# EAGLE design PTERODACTYL_v3.8_v11 (EAGLE 9.7.0)
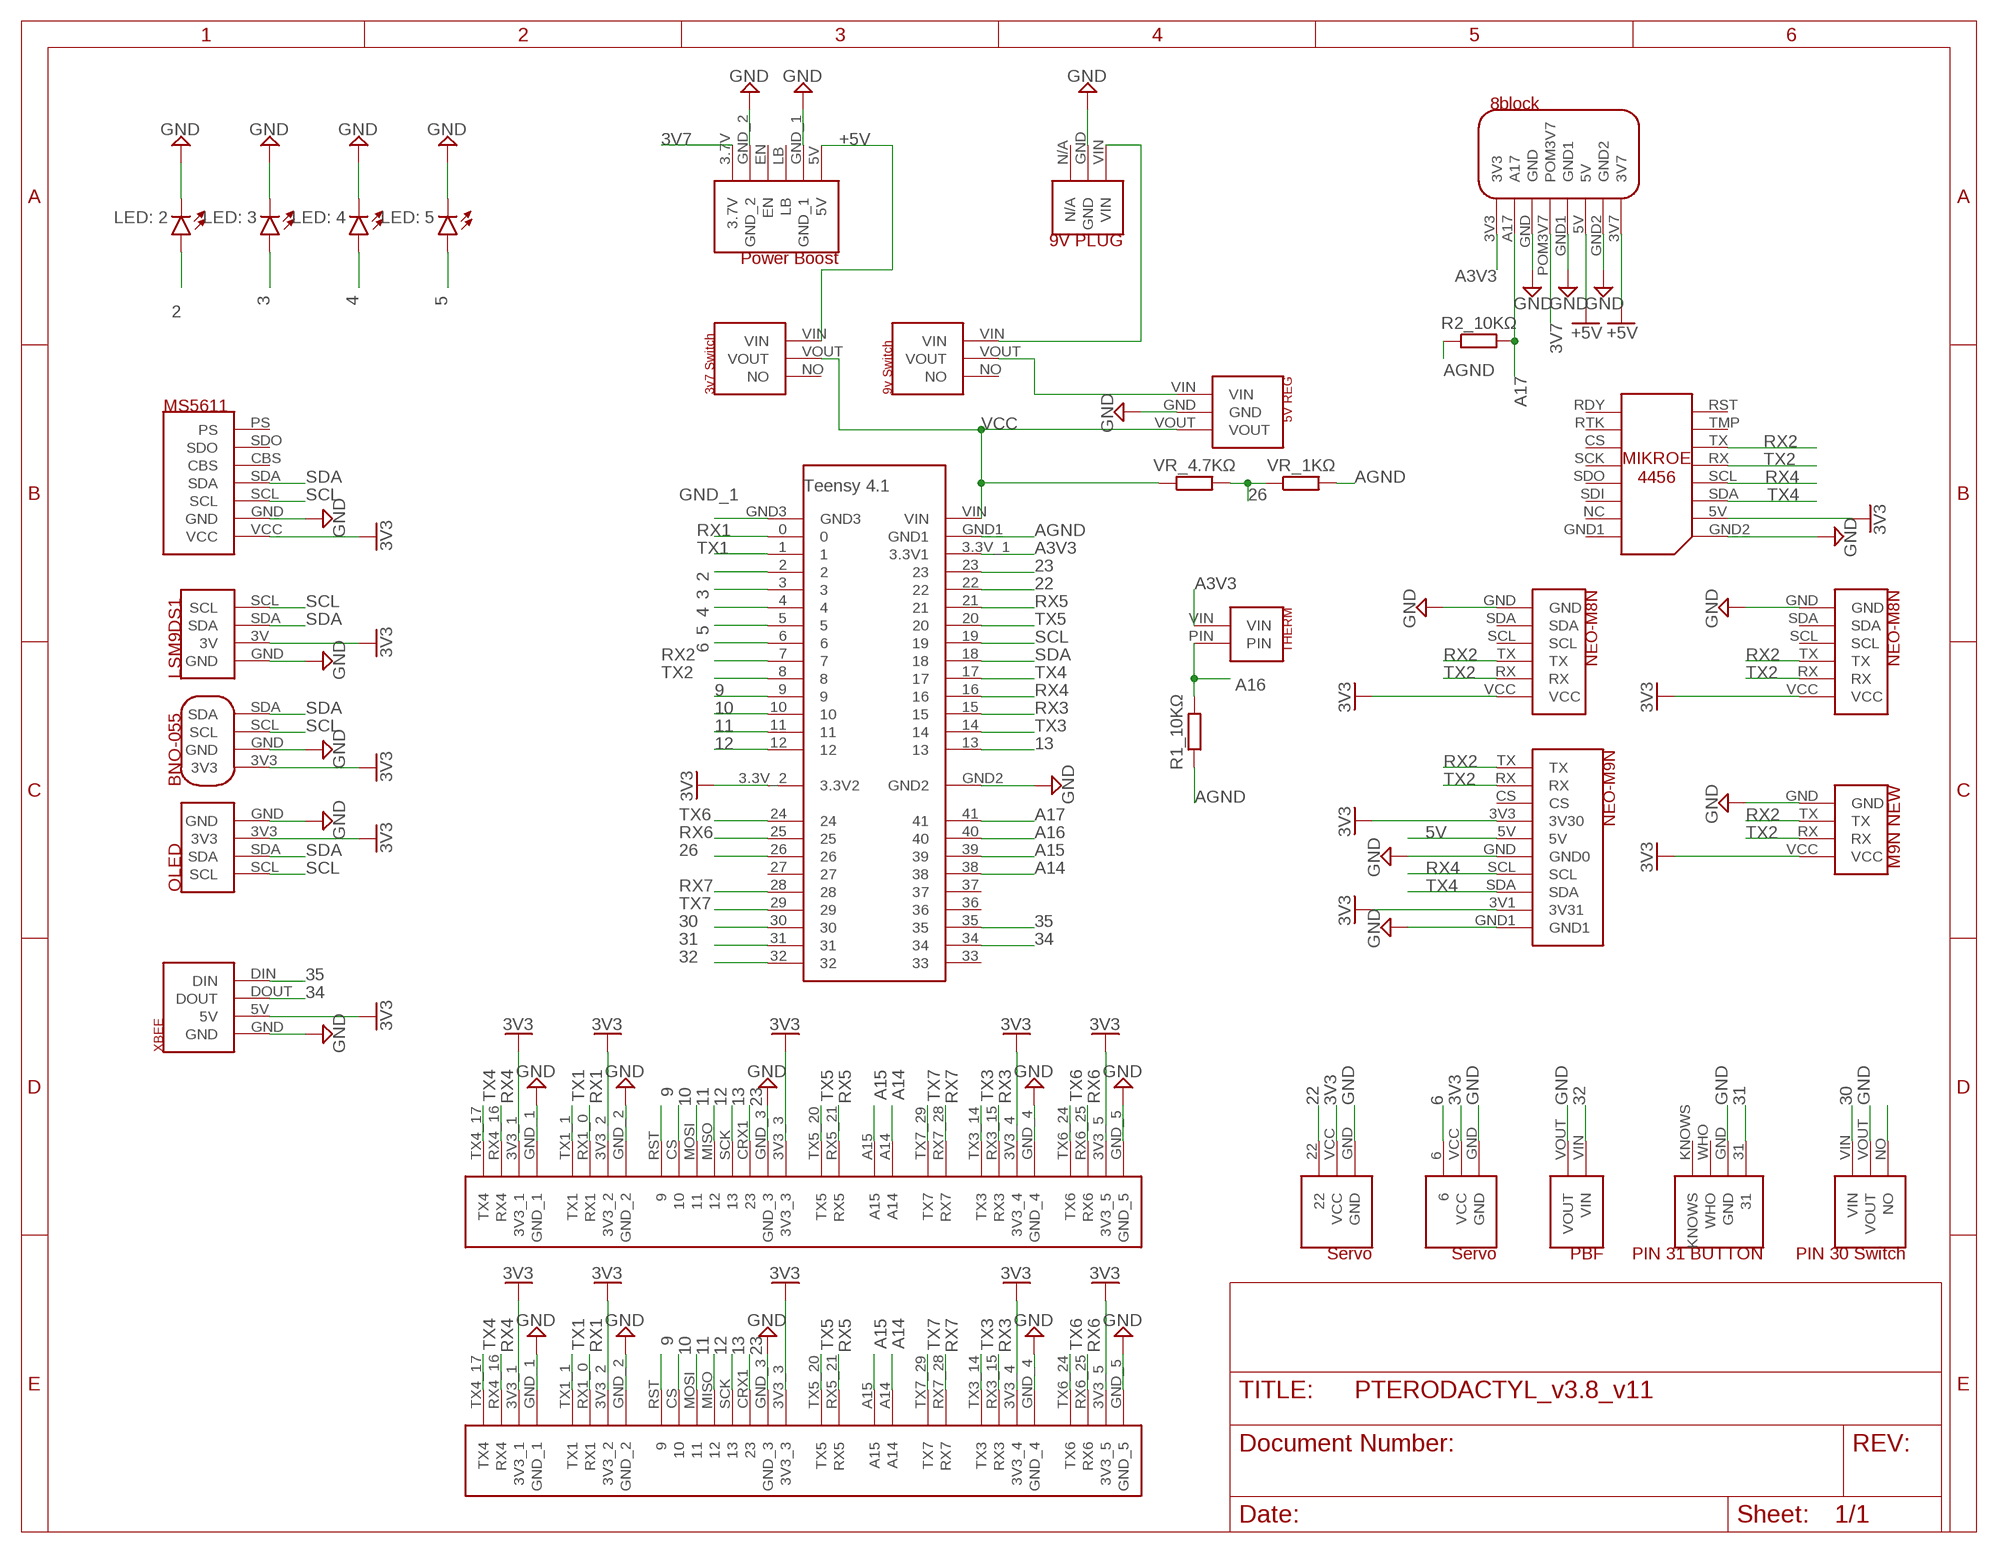
[diagram p0: schematic, sheet 1]

## Parts
D1  LED: 3  LED_RADIAL_WHITE  [LEDRD254W60D565H860B_W]
D2  LED: 4  LED_RADIAL_RED  [LEDRD254W60D565H860B]
D3  LED: 5  LED_RADIAL_BLUE  [LEDRD254W60D565H860B_B]
D4  LED: 2  LED_RADIAL_YELLOW  [LEDRD254W60D565H860B_Y]
R1_10KΩ  R_AXIAL-11.7MM-PITCH  [RESAD1176W63L850D250B]
R2_10KΩ  R_AXIAL-11.7MM-PITCH  [RESAD1176W63L850D250B]
U$1  FEMALE_HEADERS_V1.3  [FEMALE_HEADERS_V1.3]
U$2  TERMINAL_BLOCK_V1.3  [TERMINAL_BLOCK_V1.3]
U$3  TEENSY41_SIMPLE  [TEENSY41_SIMPLE]
U$4  PT8BLOCK  [PTERODACTYL8BLOCK]
U$5  5VREG  [5VREG]
U$6  3V7SWITCH  [3V7SWITCH]
U$7  9VSWITCH  [9VSWITCH]
U$8  9VPLUG  [9VPLUG]
U$9  OLED_SIMPLE  [OLED_SIMPLE]
U$10  LSM9DS1_SIMPLE  [LSM9DS1_SIMPLE]
U$11  MS5611  [MS5611]
U$12  UBLOXM8NTERMINAL  [UBLOXM8NTERMINAL]
U$13  UBLOXM8NSIMPLE  [UBLOXM8NSIMPLE]
U$14  XBEE_SIMPLE  [XBEE_SIMPLE]
U$15  UBLOXM9NSIMPLE  [UBLOXM9NSIMPLE]
U$16  THERMISTOR10K1  [THERMISTOR10K]
U$17  BNO055  [BNO055]
U$22  UBLOXM9N_NEW_SIMPLE  [UBLOXM9N_NEW_SIMPLE]
U$23  SERVO  [PIN6SERVO]
U$24  PBF  [PULLBEFOREFLIGHT]
U$25  BUTTON  [PIN31BUTTON]
U$26  PIN30SWITCH  [PIN30SWITCH]
U$27  SERVO22  [PI22SERVO]
U$28  POWERBOOST  [5VPOWERBOOST]
U$29  MIKROE  [MIKROE]
VR_1KΩ  R_AXIAL-11.7MM-PITCH  [RESAD1176W63L850D250B]
VR_4.7KΩ  R_AXIAL-11.7MM-PITCH  [RESAD1176W63L850D250B]

## Nets
2: D4.1(A) U$3.2
3: D1.1(A) U$3.3
3V3: U$1.3V3_1 U$1.3V3_2 U$1.3V3_3 U$1.3V3_4 U$1.3V3_5 U$2.3V3_1 U$2.3V3_2 U$2.3V3_3 U$2.3V3_4 U$2.3V3_5 U$3.3.3V_2(3.3V2) U$9.3V3 U$10.3V U$11.VCC U$12.VCC U$13.VCC U$14.5V U$15.3V1(3V31) U$15.3V3(3V30) U$17.3V3 U$22.VCC U$23.VCC U$27.VCC U$29.5V
3V7: U$4.POM3V7 U$28.3.7V
4: D2.1(A) U$3.4
5: D3.1(A) U$3.5
5V: U$15.5V
6: U$3.6 U$23.6
9: U$1.RST U$2.RST U$3.9
10: U$1.CS U$2.CS U$3.10
11: U$1.MOSI U$2.MOSI U$3.11
12: U$1.MISO U$2.MISO U$3.12
13: U$1.SCK U$2.SCK U$3.13
22: U$3.22 U$27.22
23: U$1.CRX1 U$2.CRX1 U$3.23
26: U$3.26 VR_1KΩ.1 VR_4.7KΩ.2
30: U$3.30 U$26.VIN
31: U$3.31 U$25.31
32: U$3.32 U$24.VIN
34: U$3.34 U$14.DOUT
35: U$3.35 U$14.DIN
+5V: U$4.3V7 U$4.5V U$6.VIN U$28.5V
A3V3: U$3.3.3V_1(3.3V1) U$4.3V3 U$16.VIN
A14: U$1.A14 U$2.A14 U$3.38
A15: U$1.A15 U$2.A15 U$3.39
A16: R1_10KΩ.2 U$3.40 U$16.PIN
A17: R2_10KΩ.2 U$3.41 U$4.A17
AGND: R1_10KΩ.1 R2_10KΩ.1 U$3.GND1 VR_1KΩ.2
GND: D1.2(C) D2.2(C) D3.2(C) D4.2(C) U$1.GND_1 U$1.GND_2 U$1.GND_3 U$1.GND_4 U$1.GND_5 U$2.GND_1 U$2.GND_2 U$2.GND_3 U$2.GND_4 U$2.GND_5 U$3.GND2 U$4.GND U$4.GND1 U$4.GND2 U$5.GND U$8.GND U$9.GND U$10.GND U$11.GND U$12.GND U$13.GND U$14.GND U$15.GND1 U$15.GND(GND0) U$17.GND U$22.GND U$23.GND U$24.VOUT U$25.GND U$26.VOUT U$27.GND U$28.GND_1 U$28.GND_2 U$29.GND2
GND_1: U$3.GND3
N$14: U$26.NO
RX1: U$1.RX1_0(RX1) U$2.RX1_0(RX1) U$3.0
RX2: U$3.7 U$12.TX U$13.TX U$15.TX U$22.TX U$29.TX
RX3: U$1.RX3_15(RX3) U$2.RX3_15(RX3) U$3.15
RX4: U$1.RX4_16(RX4) U$2.RX4_16(RX4) U$3.16 U$15.SCL U$29.SCL
RX5: U$1.RX5_21(RX5) U$2.RX5_21(RX5) U$3.21
RX6: U$1.RX6_25(RX6) U$2.RX6_25(RX6) U$3.25
RX7: U$1.RX7_28(RX7) U$2.RX7_28(RX7) U$3.28
SCL: U$3.19 U$9.SCL U$10.SCL U$11.SCL U$17.SCL
SDA: U$3.18 U$9.SDA U$10.SDA U$11.SDA U$17.SDA
TX1: U$1.TX1_1(TX1) U$2.TX1_1(TX1) U$3.1
TX2: U$3.8 U$12.RX U$13.RX U$15.RX U$22.RX U$29.RX
TX3: U$1.TX3_14(TX3) U$2.TX3_14(TX3) U$3.14
TX4: U$1.TX4_17(TX4) U$2.TX4_17(TX4) U$3.17 U$15.SDA U$29.SDA
TX5: U$1.TX5_20(TX5) U$2.TX5_20(TX5) U$3.20
TX6: U$1.TX6_24(TX6) U$2.TX6_24(TX6) U$3.24
TX7: U$1.TX7_29(TX7) U$2.TX7_29(TX7) U$3.29
VCC: U$3.VIN U$5.VOUT U$6.VOUT VR_4.7KΩ.1
VCC_2: U$7.VIN U$8.VIN
VCC_3: U$5.VIN U$7.VOUT
Unconnected: U$3.27 U$3.33 U$3.36 U$3.37 U$6.NO U$7.NO U$8.N/A U$11.CBS U$11.PS U$11.SDO U$12.SCL U$12.SDA U$13.SCL U$13.SDA U$15.CS U$25.KNOWS U$25.WHO U$28.EN U$28.LB U$29.CS U$29.GND1 U$29.NC U$29.RDY U$29.RST U$29.RTK U$29.SCK U$29.SDI U$29.SDO U$29.TMP

## Library data of the parts
D1 = Opto-Electronic:LED_RADIAL: LED - Generic; CATEGORY: Opto-Electronic; SUB-CATEGORY: LED; VALUE: LED_WHITE
D2 = Opto-Electronic:LED_RADIAL: LED - Generic; CATEGORY: Opto-Electronic; SUB-CATEGORY: LED; VALUE: LED_RED
D3 = Opto-Electronic:LED_RADIAL: LED - Generic; CATEGORY: Opto-Electronic; SUB-CATEGORY: LED; VALUE: LED_BLUE
D4 = Opto-Electronic:LED_RADIAL: LED - Generic; CATEGORY: Opto-Electronic; SUB-CATEGORY: LED; VALUE: LED_YELLOW
R1_10KΩ R2_10KΩ VR_1KΩ VR_4.7KΩ = Resistor:R: Resistor Fixed - Generic; CATEGORY: Resistor; SUB-CATEGORY: Fixed
U$1 = EXTRAPINS:FEMALE_HEADERS_V1.3
U$2 = EXTRAPINS:TERMINAL_BLOCK_V1.3
U$3 = Teensy41:TEENSY41_SIMPLE
U$4 = EXTRAPINS:PT8BLOCK
U$5 = 5V Reg:5VREG
U$6 = SWITCH:3V7SWITCH
U$7 = SWITCH:9VSWITCH
U$8 = 9V Plug:9VPLUG
U$9 = SparkFun OLED:OLED_SIMPLE
U$10 = LSM9DS1:LSM9DS1_SIMPLE
U$11 = MS5611:MS5611
U$12 = UBLOX GPS:UBLOXM8NTERMINAL
U$13 = UBLOX GPS:UBLOXM8NSIMPLE
U$14 = XBEE:XBEE_SIMPLE
U$15 = UBLOX GPS:UBLOXM9NSIMPLE
U$16 = Thermistor:THERMISTOR10K1
U$17 = BNO055:BNO055
U$22 = UBLOX GPS:UBLOXM9N_NEW_SIMPLE
U$23 = SWITCH:SERVO
U$24 = SWITCH:PBF
U$25 = SWITCH:BUTTON
U$26 = SWITCH:PIN30SWITCH
U$27 = SWITCH:SERVO22
U$28 = Power Boost 3.7 to 5v:POWERBOOST
U$29 = MIKROE_4456:MIKROE

## Board
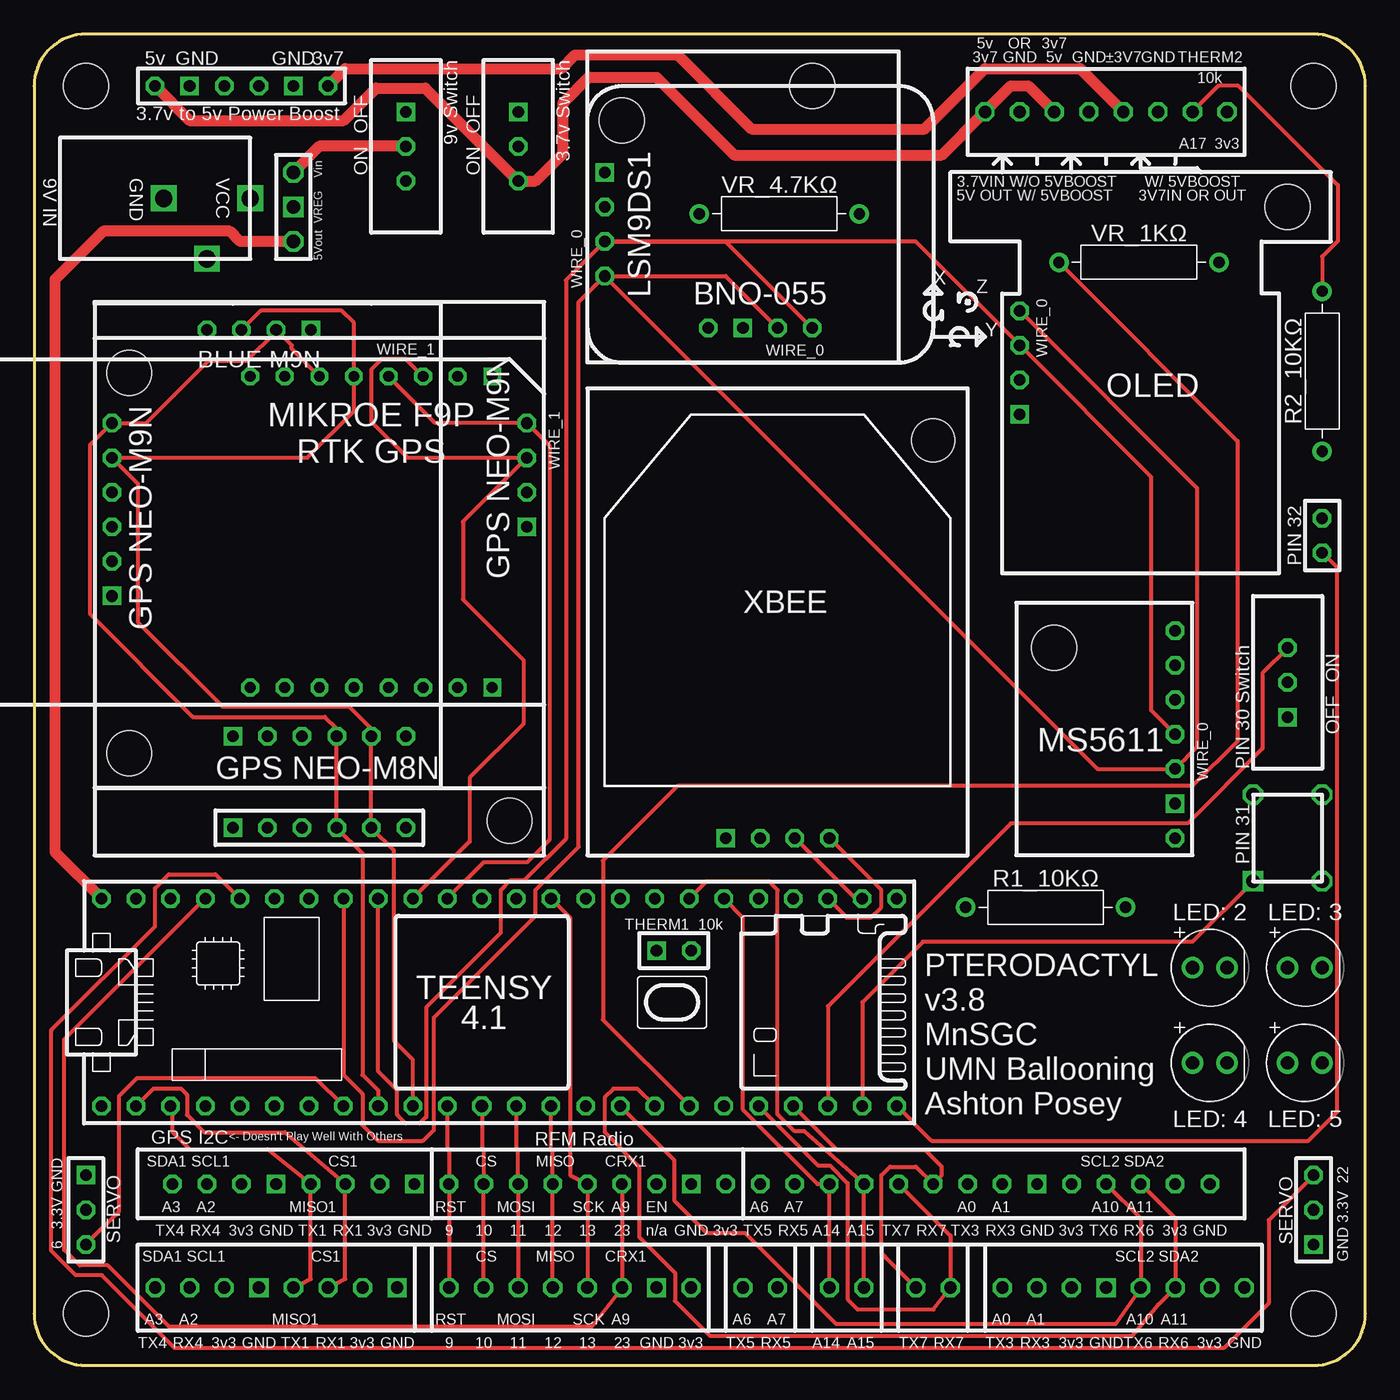
[diagram p1: board, top side]
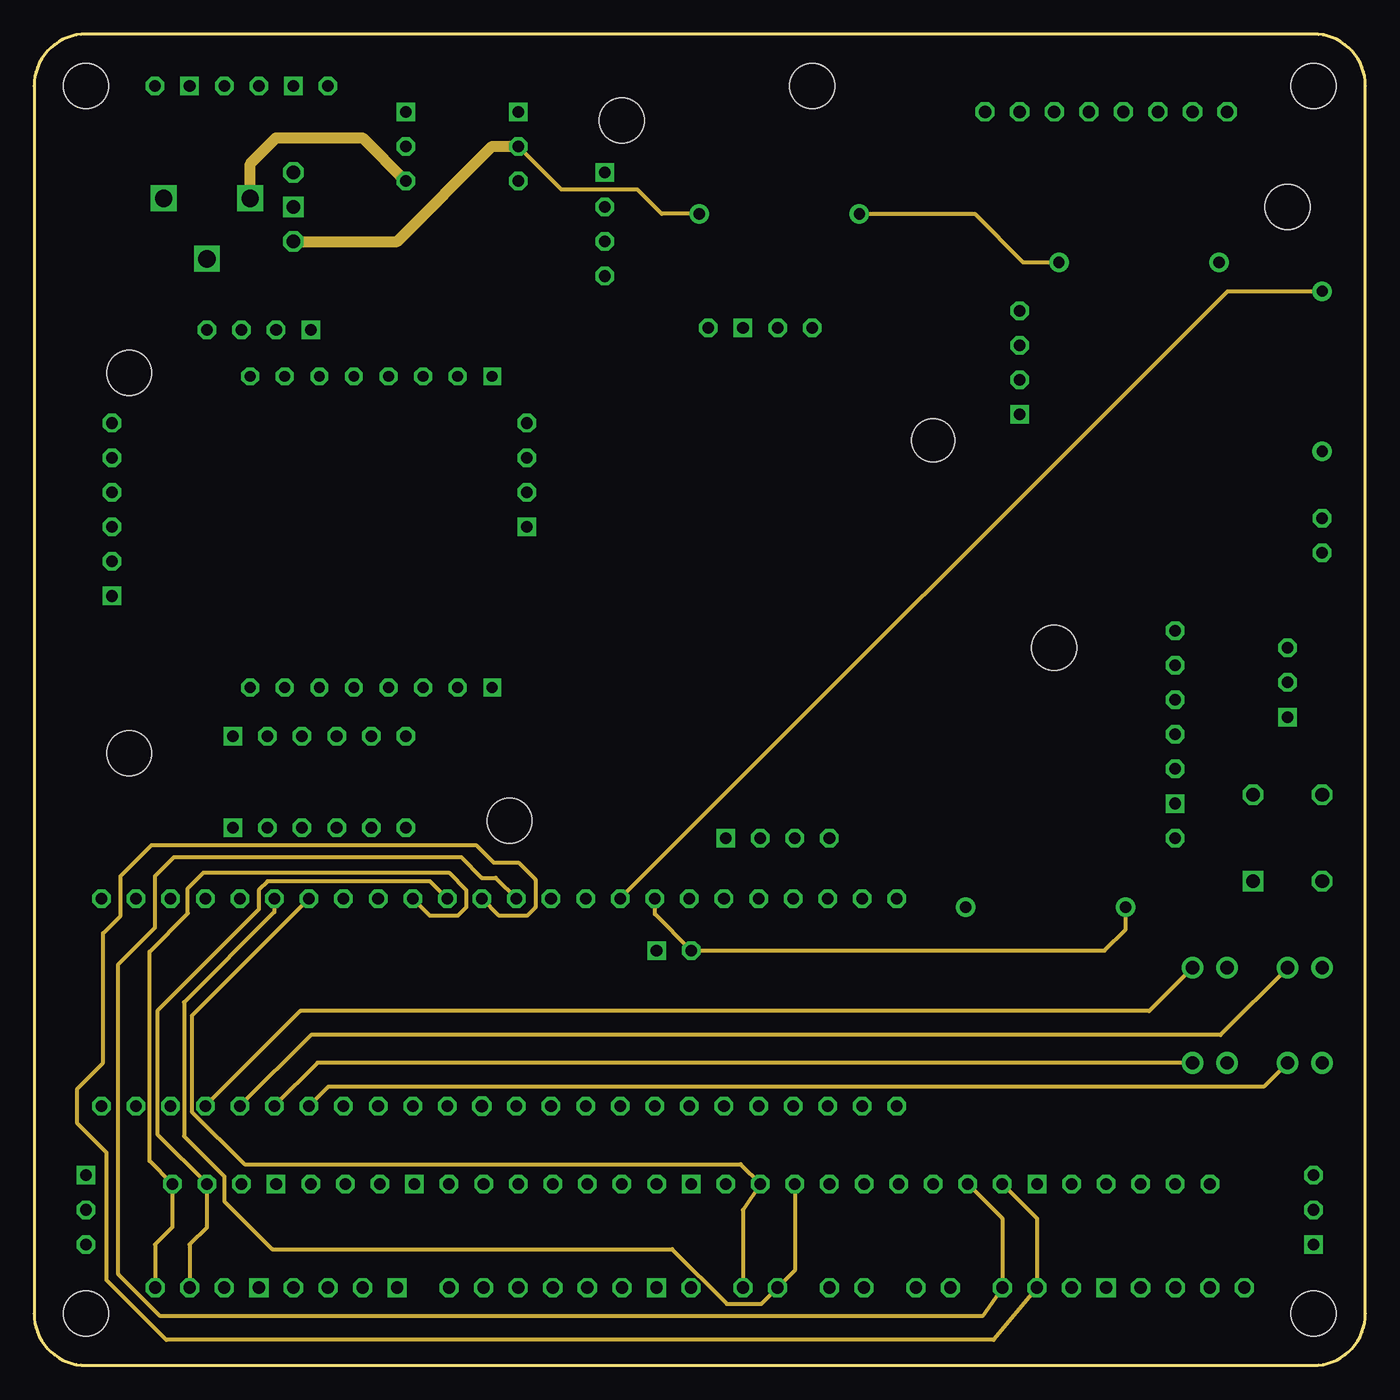
[diagram p2: board, inner layer Route2]
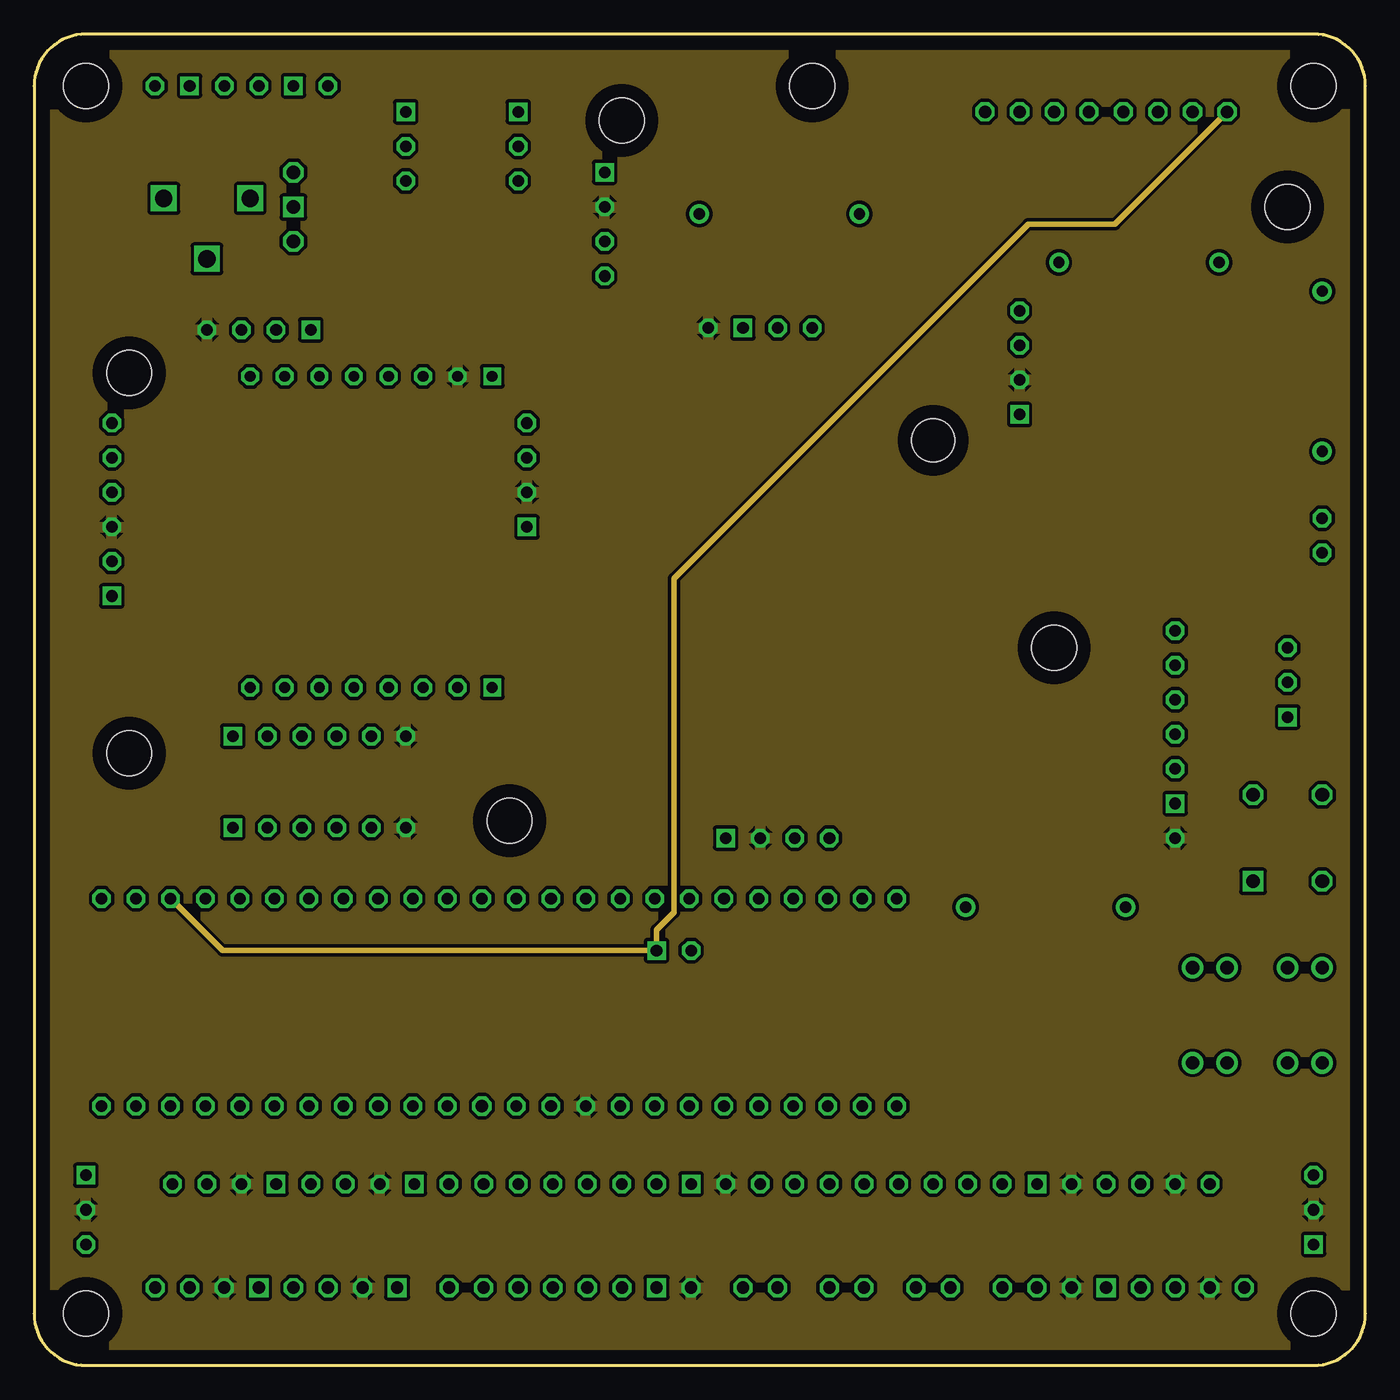
[diagram p3: board, inner layer Route15]
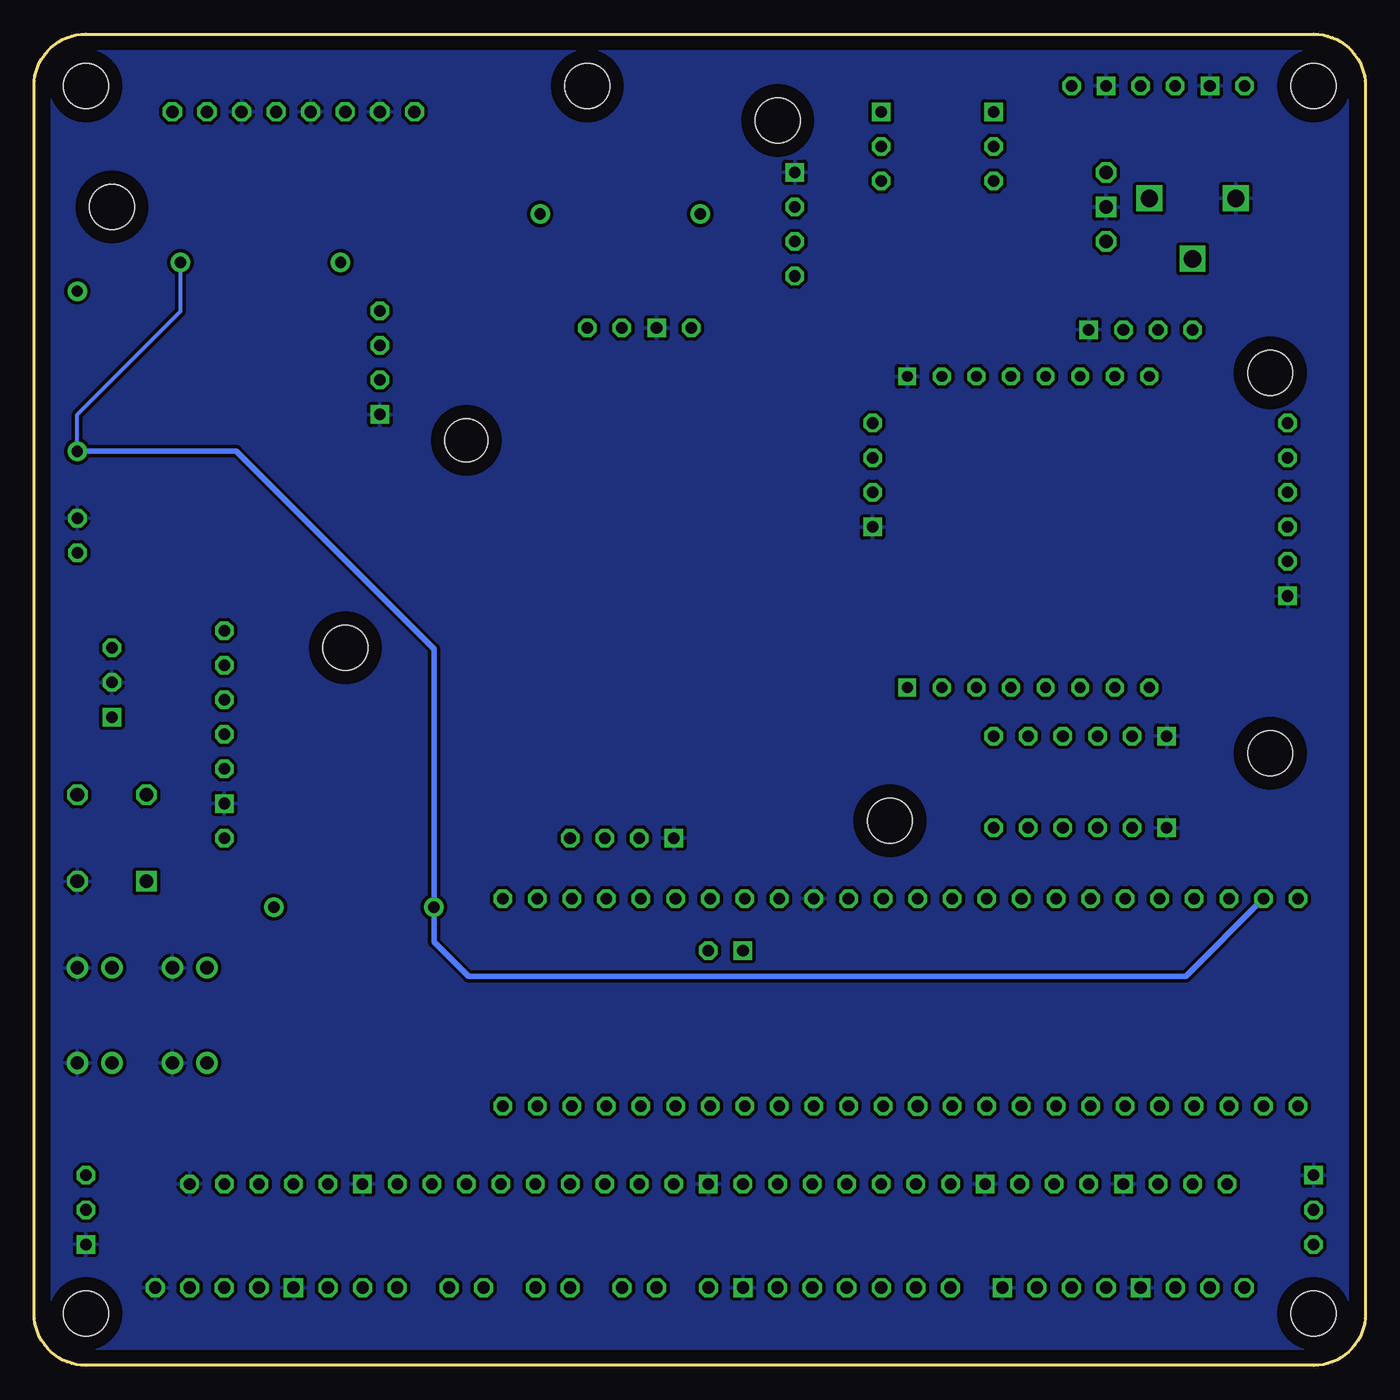
[diagram p4: board, bottom side, seen from below]

Size 97.79 x 97.79 mm. Coordinates in mm from the lower left corner, seen from the top.
Outline: 3.81,97.79 arc90 0,93.98 0,3.81 arc90 3.81,0 93.98,0 arc90 97.79,3.81 97.79,93.98 arc90 93.98,97.79 3.81,97.79
Copper layers (1+2*15+16): Top / Route2 / Route15 / Bottom
Stack-up 4 Layer Stack: Top SilkScreen Epoxy Ink / Top SolderMask User Defined 0.0254mm Dk 4.3 / Top Surface Finish Lead-Free 0.02mm / Top CuFoil:007 0.035mm / Dielectric-1 Prepreg:001 0.064mm / Dielectric-2 Prepreg:001 0.064mm / Route2 CuFoil:007 0.035mm / Dielectric-3 Core:066 0.711mm / Route15 CuFoil:007 0.035mm / Dielectric-4 Prepreg:001 0.064mm / Dielectric-5 Prepreg:001 0.064mm / Bottom CuFoil:007 0.035mm / Bottom Surface Finish Lead-Free 0.02mm / Bottom SolderMask User Defined 0.0254mm Dk 4.3 / Bottom SilkScreen Epoxy Ink
Design rules: minimum drill size 0.35mm, minimum copper width 6mil, keepout clearance 0mil, drill distance 6mil, via restrict clearance 0mil, dimension clearance 40mil, restrict clearance 0mil, copper clearance wire_polygon to wire_polygon 6mil, copper clearance wire_polygon to pad_smd 6mil, copper clearance wire_polygon to via 6mil, copper clearance pad_smd to pad_smd 6mil, copper clearance pad_smd to via 6mil, copper clearance via to via 6mil, copper clearance smd to pad (same net) 6mil, copper clearance smd to via (same net) 6mil, copper clearance smd to smd (same net) 6mil

### Footprints (pad centres in the part's own frame; a part is rotated, then mirrored left to right if it is on the bottom)
LEDRD254W60D565H860B_W = drill 0.981 pad 1.581: 1 -1.27,0; 2 1.27,0
LEDRD254W60D565H860B = drill 0.981 pad 1.581: 1 -1.27,0; 2 1.27,0
LEDRD254W60D565H860B_B = drill 0.981 pad 1.581: 1 -1.27,0; 2 1.27,0
LEDRD254W60D565H860B_Y = drill 0.981 pad 1.581: 1 -1.27,0; 2 1.27,0
RESAD1176W63L850D250B = drill 0.83 pad 1.43: 1 -5.88,0; 2 5.88,0
FEMALE_HEADERS_V1.3 = drill 0.85 octagon: 3V3_1 7.62,2.54; 3V3_2 17.78,2.54; 3V3_3 43.18,2.54; 3V3_4 68.58,2.54; 3V3_5 76.2,2.54; A14 50.8,2.54; A15 53.34,2.54; CRX1 35.56,2.54; CS 25.4,2.54; GND_5 78.74,2.54; MISO 30.48,2.54; MOSI 27.94,2.54; P$1 38.1,2.54; RST 22.86,2.54; RX1_0 15.24,2.54; RX3_15 63.5,2.54; RX4_16 5.08,2.54; RX5_21 48.26,2.54; RX6_25 73.66,2.54; RX7_28 55.88,2.54; SCK 33.02,2.54; TX1_1 12.7,2.54; TX3_14 60.96,2.54; TX4_17 2.54,2.54; TX5_20 45.72,2.54; TX6_24 71.12,2.54; TX7_29 58.42,2.54 | drill 0.85 square: GND_1 10.16,2.54; GND_2 20.32,2.54; GND_3 40.64,2.54; GND_4 66.04,2.54
TERMINAL_BLOCK_V1.3 = drill 0.9 octagon: 3V3_1 5.08,3.175; 3V3_2 15.24,3.175; 3V3_3 39.37,3.175; 3V3_4 67.31,3.175; 3V3_5 77.47,3.175; A14 49.53,3.175; A15 52.07,3.175; CRX1 34.29,3.175; CS 24.13,3.175; GND_5 80.01,3.175; MISO 29.21,3.175; MOSI 26.67,3.175; RST 21.59,3.175; RX1_0 12.7,3.175; RX3_15 64.77,3.175; RX4_16 2.54,3.175; RX5_21 45.72,3.175; RX6_25 74.93,3.175; RX7_28 58.42,3.175; SCK 31.75,3.175; TX1_1 10.16,3.175; TX3_14 62.23,3.175; TX4_17 0,3.175; TX5_20 43.18,3.175; TX6_24 72.39,3.175; TX7_29 55.88,3.175 | drill 0.9 square: GND_1 7.62,3.175; GND_2 17.78,3.175; GND_3 36.83,3.175; GND_4 69.85,3.175
TEENSY41_SIMPLE = drill 0.85 octagon: 0 -25.527,-7.62; 1 -22.987,-7.62; 2 -20.447,-7.62; 3 -17.907,-7.62; 3.3V_1 -22.987,7.62; 3.3V_2 7.493,-7.62; 4 -15.367,-7.62; 5 -12.827,-7.62; 6 -10.287,-7.62; 7 -7.747,-7.62; 8 -5.207,-7.62; 9 -2.667,-7.62; 11 2.413,-7.62; 12 4.953,-7.62; 13 4.953,7.62; 14 2.413,7.62; 15 -0.127,7.62; 16 -2.667,7.62; 17 -5.207,7.62; 18 -7.747,7.62; 19 -10.287,7.62; 20 -12.827,7.62; 21 -15.367,7.62; 22 -17.907,7.62; 23 -20.447,7.62; 24 10.033,-7.62; 25 12.573,-7.62; 26 15.113,-7.62; 27 17.653,-7.62; 28 20.193,-7.62; 29 22.733,-7.62; 30 25.273,-7.62; 31 27.813,-7.62; 32 30.353,-7.62; 33 30.353,7.62; 34 27.813,7.62; 35 25.273,7.62; 36 22.733,7.62; 37 20.193,7.62; 38 17.653,7.62; 39 15.113,7.62; 40 12.573,7.62; 41 10.033,7.62; GND1 -25.527,7.62; GND2 7.493,7.62; GND3 -28.067,-7.62; VIN -28.067,7.62 | drill 0.9 octagon: 10 -0.127,-7.62
PTERODACTYL8BLOCK = drill 0.9 octagon: 3V3 1.27,3.175; 3V7 19.05,3.175; 5V 13.97,3.175; A17 3.81,3.175; GND 6.35,3.175; GND1 11.43,3.175; GND2 16.51,3.175; POM3V7 8.89,3.175
5VREG = drill 1 square: GND 3.81,1.27 | drill 1 octagon: VIN 1.27,1.27; VOUT 6.35,1.27
3V7SWITCH = drill 0.85 square: NO 3.81,2.54 | drill 0.85 octagon: VIN 8.89,2.54; VOUT 6.35,2.54
9VSWITCH = drill 0.85 square: NO -2.54,0 | drill 0.85 octagon: VIN 2.54,0; VOUT 0,0
9VPLUG = drill 1.27 square: GND 7.62,4.445; N/A 10.795,0; VIN 13.97,4.445
OLED_SIMPLE = drill 0.85 octagon: 3V3 1.27,-6.35; SCL 1.27,-1.27; SDA 1.27,-3.81 | drill 0.85 square: GND 1.27,-8.89 | hole 3.302: 20.955,6.35
LSM9DS1_SIMPLE = drill 0.85 octagon: 3V 1.27,11.43; SCL 1.27,6.35; SDA 1.27,8.89 | drill 0.85 square: GND 1.27,13.97 | hole 3.302: 16.51,20.32
MS5611 = drill 0.85 octagon: CBS -1.27,11.43; PS -1.27,16.51; SCL -1.27,6.35; SDA -1.27,8.89; SDO -1.27,13.97; VCC -1.27,1.27 | drill 0.85 square: GND -1.27,3.81 | hole 3.302: -10.16,15.24
UBLOXM8NTERMINAL = drill 0.85 square: GND 1.27,1.27 | drill 0.85 octagon: RX 11.43,1.27; SCL 6.35,1.27; SDA 3.81,1.27; TX 8.89,1.27; VCC 13.97,1.27
UBLOXM8NSIMPLE = drill 0.85 square: GND 10.16,3.81 | drill 0.85 octagon: RX 20.32,3.81; SCL 15.24,3.81; SDA 12.7,3.81; TX 17.78,3.81; VCC 22.86,3.81 | hole 3.302: 2.54,30.48
XBEE_SIMPLE = drill 0.85 octagon: 5V 12.7,1.27; DIN 17.78,1.27; DOUT 15.24,1.27 | drill 0.85 square: GND 10.16,1.27 | hole 3.175: 25.4,30.48
UBLOXM9NSIMPLE = drill 0.85 octagon: 3V1 1.27,13.97; 3V3 31.75,16.51; 5V 31.75,19.05; CS 31.75,13.97; RX 31.75,11.43; SCL 1.27,8.89; SDA 1.27,11.43; TX 31.75,8.89 | drill 0.85 square: GND 31.75,21.59; GND1 1.27,16.51 | hole 3.302: 2.54,38.1
THERMISTOR10K = drill 0.85 octagon: PIN 3.81,1.27 | drill 0.85 square: VIN 1.27,1.27
BNO055 = drill 0.85 octagon: 3V3 8.89,2.54; SCL 13.97,2.54; SDA 16.51,2.54 | drill 0.85 square: GND 11.43,2.54 | hole 3.302: 2.54,17.78
HOLE = hole 3.302: 0,0
UBLOXM9N_NEW_SIMPLE = drill 0.85 square: GND 9.525,1.905 | drill 0.85 octagon: RX 14.605,1.905; TX 12.065,1.905; VCC 17.145,1.905 | hole 3.302: 22.86,33.02
PIN6SERVO = drill 0.85 octagon: 6 6.35,1.27; VCC 3.81,1.27 | drill 0.85 square: GND 1.27,1.27
PULLBEFOREFLIGHT = drill 0.85 octagon: VIN 1.27,1.27; VOUT 3.81,1.27
PIN31BUTTON = drill 1 square: 31 0,0 | drill 1 octagon: GND 5.08,0; KNOWS 5.08,6.35; WHO 0,6.35
PIN30SWITCH = drill 0.85 square: NO -2.54,0 | drill 0.85 octagon: VIN 2.54,0; VOUT 0,0
PI22SERVO = drill 0.85 octagon: 22 6.35,1.27; VCC 3.81,1.27 | drill 0.85 square: GND 1.27,1.27
5VPOWERBOOST = drill 0.85 octagon: 3.7V -6.35,0; 5V 6.35,0; EN 1.27,0; LB -1.27,0 | drill 0.85 square: GND_1 -3.81,0; GND_2 3.81,0
MIKROE = drill 0.8 octagon: 5V 24.13,6.35; CS 1.27,16.51; NC 1.27,6.35; RDY 1.27,21.59; RST 24.13,21.59; RTK 1.27,19.05; RX 24.13,13.97; SCK 1.27,13.97; SCL 24.13,11.43; SDA 24.13,8.89; SDI 1.27,8.89; SDO 1.27,11.43; TMP 24.13,19.05; TX 24.13,16.51 | drill 0.8 square: GND1 1.27,3.81; GND2 24.13,3.81

### Placement (x,y rotation side)
D1  93.34,29.21 0 top
D2  86.36,22.23 0 top
D3  93.34,22.23 0 top
D4  86.36,29.21 0 top
R1_10KΩ  74.3,33.66 0 top
R2_10KΩ  94.62,73.03 90 top
U$1  7.62,10.79 0 top
U$2  8.89,2.54 0 top
U$3  33.02,26.67 0 top
U$4  88.9,95.25 180 top
U$5  17.78,88.9 270 top
U$6  33.02,95.89 270 top
U$7  27.31,89.53 270 top
U$8  1.91,81.28 0 top
U$9  71.12,78.74 0 top
U$10  40.64,73.66 0 top
U$11  85.09,37.47 0 top
U$12  13.34,38.23 0 top
U$13  4.45,42.42 0 top
U$14  40.64,37.47 0 top
U$15  37.47,78.11 180 top
U$16  44.45,29.21 0 top
U$17  40.64,73.66 0 top
U$18  [HOLE]  93.98,3.81 0 bottom
U$19  [HOLE]  93.98,93.98 0 bottom
U$20  [HOLE]  3.81,93.98 0 bottom
U$21  [HOLE]  3.81,3.81 0 bottom
U$22  29.85,77.98 180 top
U$23  2.54,15.24 270 top
U$24  95.89,58.42 90 top
U$25  89.54,35.56 0 top
U$26  92.08,50.16 90 top
U$27  95.25,7.62 90 top
U$28  15.24,93.98 180 top
U$29  37.47,48.51 90 top
U$30  [PTERODACTYLV3.1]  65.41,18.41 0 top
U$32  [AXIS]  65.41,74.93 0 top
VR_1KΩ  81.15,81.03 0 top
VR_4.7KΩ  54.74,84.58 0 top

### Tracks (layer width: path | path; a pad name or v marks a point on that pad's centre or on a via)
2
  Route2 0.305: D4.1 81.92,26.04 19.56,26.04 U$3.2
3
  Route2 0.305: D1.1 87.14,24.28 20.34,24.28 U$3.3
3V3
  pour Route15 (isolate 0.25): 1.27,96.52 96.52,96.52 96.52,1.27 1.27,1.27
3V7
  Top 0.813: U$28.3.7V 22.86,95.25 38.74,95.25 39.75,96.27 47.24,96.27 52.71,90.81 65.41,90.81 69.85,95.25 76.84,95.25 U$4.POM3V7
4
  Route2 0.305: D2.1 20.83,22.23 U$3.4
5
  Route2 0.305: D3.1 90.32,20.47 21.61,20.47 U$3.5
6
  Top 0.305: U$23.6 6.22,11.3 6.22,19.77 7.55,21.1 20.68,21.1 U$3.6
9
  Top 0.305: U$2.RST U$1.RST 30.48,15.88 30.35,16 U$3.9
10
  Top 0.305: U$2.CS U$1.CS 33.02,15.88 32.89,16 U$3.10
11
  Top 0.305: U$3.11 35.43,15.88 35.56,15.75 U$1.MOSI U$2.MOSI
12
  Top 0.305: U$2.MISO U$1.MISO 38.1,15.75 37.97,15.88 U$3.12
13
  Top 0.305: U$2.SCK U$1.SCK 39.37,13.97 39.37,32.89 U$3.13
22
  Top 0.305: U$27.22 90.68,10.67 90.68,4.57 87.38,1.27 10.34,1.27 4.98,6.63 3.05,6.63 1.27,8.41 1.27,24.64 8.89,32.26 8.89,35.05 9.91,36.07 13.34,36.07 U$3.22
23
  Top 0.305: U$1.CRX1 U$2.CRX1 40.95,2.85 9.91,2.85 5.42,7.34 3.37,7.34 2.22,8.49 2.22,23.93 U$3.23
26
  Top 0.305: VR_1KΩ.1 88.39,67.91 88.39,45.85 85.09,42.55 47.24,42.55 41.78,37.08 41.78,25.4 U$3.26
  Route2 0.305: VR_4.7KΩ.2 69.09,84.58 72.64,81.03 VR_1KΩ.1
30
  Top 0.305: U$26.VIN 90.22,50.85 90.22,45.3 84.73,39.81 71.73,39.81 58.29,26.38 U$3.30
31
  Top 0.305: U$25.31 85.09,31.11 65.28,31.11 60.83,26.67 U$3.31
32
  Top 0.305: U$3.32 65.91,16.51 93.59,16.51 95.71,18.63 95.71,58.59 U$24.VIN
34
  Top 0.305: U$14.DOUT 60.33,34.29 U$3.34
35
  Top 0.305: U$3.35 59.69,32.89 61.47,32.89 62.23,33.66 62.23,34.92 U$14.DIN
+5V
  Top 0.813: U$28.5V 11.43,91.44 22.73,91.44 25.11,93.82 28.73,93.82 U$6.VIN 36.83,87 38.84,89 38.84,92.71 40.74,94.61 45.72,94.61 51.44,88.9 66.68,88.9 U$4.3V7 71.76,93.98 73.03,93.98 U$4.5V
A3V3
  Route15 0.406: U$3.3.3V_1 13.84,30.48 U$16.VIN 45.72,32 46.99,33.27 46.99,57.78 73.03,83.82 79.38,83.82 U$4.3V3
A14
  Top 0.305: U$2.A14 U$1.A14 57.54,13.34 52.05,18.82 52.05,32.91 U$3.38
A15
  Top 0.305: U$2.A15 U$1.A15 56.57,17.21 55.86,17.21 55.26,17.8 54.65,18.41 54.61,18.41 54.61,34.92 53.98,35.56 49.4,35.56 U$3.39
A16
  Route2 0.305: R1_10KΩ.2 80.18,32.04 78.61,30.48 U$16.PIN 45.59,33.15 U$3.40
A17
  Top 0.305: R2_10KΩ.2 94.62,81.44 95.76,82.59 95.76,86.69 88.47,93.98 87,93.98 U$4.A17
  Route2 0.305: U$3.41 87.67,78.91 R2_10KΩ.2
AGND
  Bottom 0.305: R2_10KΩ.1 94.62,69.85 87.03,77.43 VR_1KΩ.2
  Bottom 0.406: U$3.GND1 13.21,28.57 65.88,28.57 68.42,31.11 R1_10KΩ.1 68.42,52.63 82.93,67.14 R2_10KΩ.1
GND
  pour Bottom (isolate 0.25): 96.52,96.52 96.52,0.87 1.27,0.87 1.27,96.52
RX1
  Top 0.305: U$2.RX1_0 22.86,6.35 U$1.RX1_0 18.43,17.14 12.5,17.14 11.24,18.39 11.24,19.87 10.8,20.32 8.76,20.32 U$3.0
RX2
  Top 0.305: U$3.7 25.27,20.19 24.13,21.34 24.13,37.59 U$12.TX U$13.TX 22.23,46.78 21.36,47.65 11.66,47.65 4.1,55.21 4.1,67.6 U$15.TX 8.26,69.22 12.83,73.79 15.62,73.79 17.78,75.95 | 17.78,75.95 U$22.TX | U$29.TX 18.92,74.68 18.92,74.93 17.91,75.95 17.78,75.95
RX3
  Route2 0.305: U$1.RX3_15 73.66,10.79 U$2.RX3_15 70.47,1.89 9.72,1.89 5.33,6.27 5.33,15.62 3.18,17.78 3.18,20.32 5.08,22.23 5.08,31.75 6.35,33.02 6.35,35.94 8.64,38.23 32.46,38.23 33.76,36.93 35.59,36.93 36.83,35.69 36.83,33.66 36.2,33.02 34.16,33.02 U$3.15
RX4
  Top 0.305: U$3.16 33.02,36.96 36.2,36.96 37.85,38.61 37.85,67.56 U$15.SCL 29.46,69.22 U$29.SCL
  Route2 0.305: U$2.RX4_16 11.43,8.89 12.7,10.16 U$1.RX4_16 9.05,16.99 9.05,26.04 16.51,33.5 16.51,34.92 17.15,35.56 29.08,35.56 U$3.16
RX5
  Route2 0.305: U$1.RX5_21 55.88,6.99 U$2.RX5_21 53.42,4.52 50.88,4.52 46.87,8.54 17.5,8.54 13.97,12.06 13.97,13.88 11.02,16.84 11.02,26.67 17.65,33.31 U$3.21
RX6
  Top 0.305: U$1.RX6_25 83.82,10.79 U$2.RX6_25 82.56,4.46 80.68,2.19 49.63,2.19 47.07,4.75 47.07,6.82 44.45,9.44 44.45,14.61 41.91,17.14 41.91,19.68 42.55,20.32 44.32,20.32 U$3.25
RX7
  Top 0.305: U$3.28 57.58,14.68 58.46,14.68 59.75,13.4 59.75,4.86 60.49,4.12 66.07,4.12 U$2.RX7_28 67.31,9.53 U$1.RX7_28
SCL
  Top 0.305: U$9.SCL 85.41,64.45 85.41,45.41 U$11.SCL 78.11,43.81 U$10.SCL | U$10.SCL | U$3.19 22.73,21.34 24.13,19.94 24.13,17.65 25.27,16.51 28.58,16.51 29.37,17.3 29.37,25.56 36.83,33.02 36.83,34.92 40.01,38.1 40.01,78.1 U$10.SCL | U$10.SCL 50.8,80.01 U$17.SCL
SDA
  Top 0.305: U$11.SDA 82.06,48.11 82.06,65.26 U$9.SDA 64.77,82.55 U$10.SDA | U$3.18 25.27,21.59 26.67,20.19 26.67,18.41 27.31,17.78 28.32,17.78 28.8,18.26 28.8,26.3 34.27,31.77 34.27,34.9 34.98,35.61 36,35.61 39.07,38.67 39.07,79.7 U$10.SDA | U$10.SDA 50.8,82.55 U$17.SDA
TX1
  Top 0.305: U$2.TX1_1 20.32,6.35 U$1.TX1_1 17.15,15.88 11.43,15.88 10.16,17.14 10.16,18.92 U$3.1
TX2
  Top 0.305: U$3.8 27.81,22.48 26.42,23.88 26.42,37.85 U$12.RX U$13.RX 24.77,46.78 23.16,48.39 13.84,48.39 7.62,54.61 7.62,64.77 U$15.RX 20.07,66.67 23.5,70.1 U$29.RX 23.5,76.58 22.61,77.47 16.64,77.47 U$22.RX
TX3
  Route2 0.305: U$1.TX3_14 71.12,10.79 U$2.TX3_14 69.65,3.61 9.28,3.61 6.19,6.7 6.19,29.46 8.89,32.16 8.89,35.94 10.28,37.34 31.37,37.34 32.89,35.81 33.91,35.81 U$3.14
TX4
  Top 0.305: U$3.17 32,38.48 32,43.18 35.94,47.12 35.94,51.82 31.5,56.26 31.5,61.98 U$15.SDA 27.43,66.67 24.77,69.34 24.77,73.15 25.53,73.91 27.31,73.91 U$29.SDA
  Route2 0.305: U$2.TX4_17 8.89,8.89 10.16,10.16 U$1.TX4_17 8.48,15.02 8.48,30.39 11.3,33.21 11.3,35.05 12.45,36.2 30.48,36.2 31.75,34.92 31.75,33.66 31.12,33.02 29.08,33.02 U$3.17
TX5
  Route2 0.305: U$2.TX5_20 52.07,11.43 U$1.TX5_20 51.9,14.78 15.46,14.78 11.59,18.64 11.59,25.69 U$3.20
TX6
  Top 0.305: 66.54,3.03 | 66.54,3.03 79.43,3.03 U$2.TX6_24 81.28,10.79 U$1.TX6_24 | 66.54,3.03 58.93,3.03 52.25,9.71 49.41,9.71 47.02,12.1 47.02,15.08 U$3.24
TX7
  Top 0.305: U$3.29 58.99,15.81 65.47,15.81 66.68,14.61 66.68,13.97 U$1.TX7_29 64.77,14.61 62.87,14.61 62.23,13.97 62.23,8.26 62.52,7.97 62.55,7.94 U$2.TX7_29
VCC
  Top 0.813: U$3.VIN 1.52,37.72 1.52,79.76 5.07,83.3 14.39,83.3 15.14,82.55 U$5.VOUT
  Route2 0.305: VR_4.7KΩ.1 46.1,84.58 44.32,86.36 38.74,86.36 U$6.VOUT
  Route2 0.813: U$5.VOUT 26.67,82.55 33.66,89.53 U$6.VOUT
VCC_2
  Route2 0.813: U$8.VIN 15.88,88.27 17.78,90.17 24.13,90.17 U$7.VIN
VCC_3
  Top 0.813: U$5.VIN 20.96,89.53 U$7.VOUT

### Text on the board
tNames: WIRE_0 | WIRE_0 | WIRE_1 | WIRE_0 | WIRE_1 | WIRE_0 | <- Doesn't Play Well With Others | GPS I2C